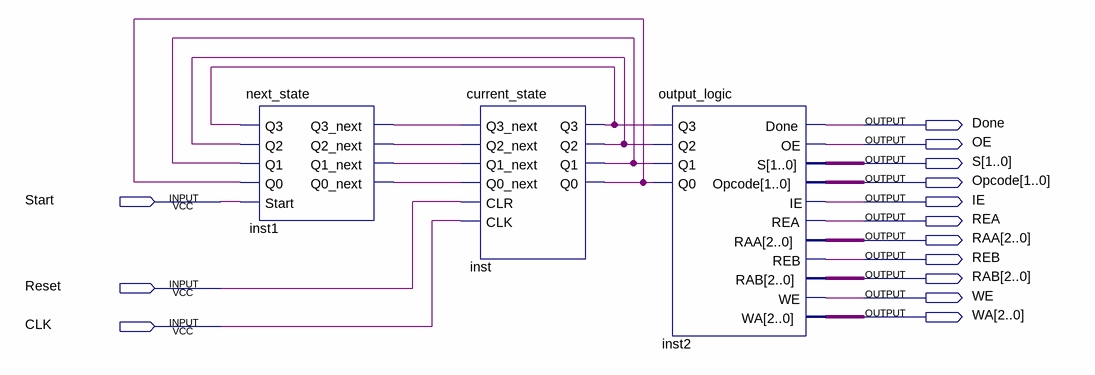
[diagram p0: schematic sheet]
// Quartus schematic control.bdf as structural Verilog: 3 symbols, 14 pins
module control (
  input  Start,
  input  Reset,
  input  CLK,
  output Done,
  output OE,
  output [1:0] S,
  output [1:0] Opcode,
  output IE,
  output REA,
  output [2:0] RAA,
  output REB,
  output [2:0] RAB,
  output WE,
  output [2:0] WA
);

  wire inst1_q0_next, inst1_q1_next, inst1_q2_next, inst1_q3_next, inst_q0, inst_q1, inst_q2, inst_q3;

  next_state inst1 (
    .Q3(inst_q3), .Q2(inst_q2), .Q1(inst_q1), .Q0(inst_q0), .Start(Start), .Q3_next(inst1_q3_next),
    .Q2_next(inst1_q2_next), .Q1_next(inst1_q1_next), .Q0_next(inst1_q0_next));
  current_state inst (
    .Q3_next(inst1_q3_next), .Q2_next(inst1_q2_next), .Q1_next(inst1_q1_next), .Q0_next(inst1_q0_next),
    .CLR(Reset), .CLK(CLK), .Q3(inst_q3), .Q2(inst_q2), .Q1(inst_q1), .Q0(inst_q0));
  output_logic inst2 (
    .Q3(inst_q3), .Q2(inst_q2), .Q1(inst_q1), .Q0(inst_q0), .Done(Done), .OE(OE), .S(S), .Opcode(Opcode),
    .IE(IE), .REA(REA), .RAA(RAA), .REB(REB), .RAB(RAB), .WE(WE), .WA(WA));
endmodule
